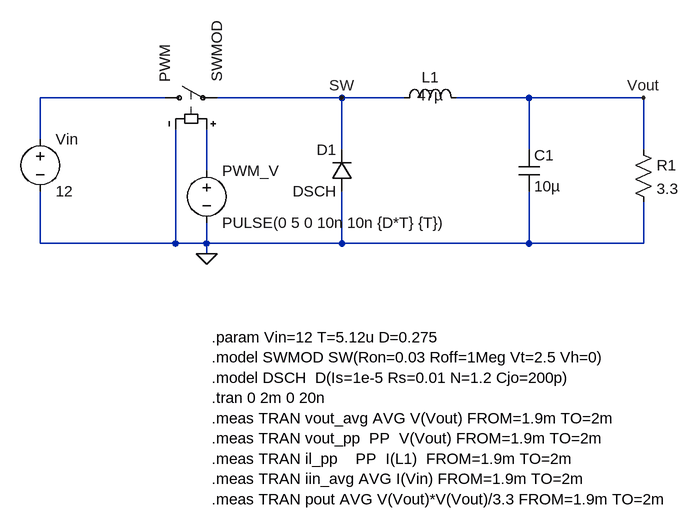
[diagram p0: schematic buck converter - 1.asc]
buck converter - 1.asc, the LTspice schematic file:
Version 4.1
SHEET 1 1080 680
WIRE 256 16 64 16
WIRE 528 16 336 16
WIRE 624 16 528 16
WIRE 816 16 704 16
WIRE 992 16 816 16
WIRE 64 80 64 16
WIRE 528 96 528 16
WIRE 816 96 816 16
WIRE 992 96 992 16
WIRE 320 128 320 64
WIRE 64 240 64 160
WIRE 272 240 272 64
WIRE 272 240 64 240
WIRE 320 240 320 208
WIRE 320 240 272 240
WIRE 528 240 528 160
WIRE 528 240 320 240
WIRE 816 240 816 160
WIRE 816 240 528 240
WIRE 992 240 992 176
WIRE 992 240 816 240
WIRE 320 256 320 240
FLAG 320 256 0
FLAG 528 16 SW
FLAG 992 16 Vout
SYMBOL voltage 64 64 R0
WINDOW 123 0 0 Left 0
WINDOW 39 0 0 Left 0
SYMATTR InstName Vin
SYMATTR Value 12
SYMBOL voltage 320 112 R0
WINDOW 123 0 0 Left 0
WINDOW 39 0 0 Left 0
SYMATTR InstName PWM_V
SYMATTR Value PULSE(0 5 0 10n 10n {D*T} {T})
SYMBOL sw 240 16 R270
SYMATTR InstName PWM
SYMATTR Value SWMOD
SYMBOL diode 544 160 R180
WINDOW 0 24 64 Left 2
WINDOW 3 24 0 Left 2
SYMATTR InstName D1
SYMATTR Value DSCH
SYMBOL ind 608 32 R270
WINDOW 0 32 56 VTop 2
WINDOW 3 4 56 VTop 2
SYMATTR InstName L1
SYMATTR Value 47µ
SYMATTR SpiceLine Rser=50m
SYMBOL cap 800 96 R0
SYMATTR InstName C1
SYMATTR SpiceLine Rser=20m
SYMATTR Value 10µ
SYMBOL res 976 80 R0
SYMATTR InstName R1
SYMATTR Value 3.3
TEXT 328 384 Left 2 !.param Vin=12 T=5.12u D=0.275\n.model SWMOD SW(Ron=0.03 Roff=1Meg Vt=2.5 Vh=0)\n.model DSCH  D(Is=1e-5 Rs=0.01 N=1.2 Cjo=200p)\n.tran 0 2m 0 20n\n.meas TRAN vout_avg AVG V(Vout) FROM=1.9m TO=2m\n.meas TRAN vout_pp  PP  V(Vout) FROM=1.9m TO=2m\n.meas TRAN il_pp    PP  I(L1)  FROM=1.9m TO=2m\n.meas TRAN iin_avg AVG I(Vin) FROM=1.9m TO=2m\n.meas TRAN pout AVG V(Vout)*V(Vout)/3.3 FROM=1.9m TO=2m

The netlist it stands for:
* buck converter - 1.asc
Vin N001 0 12
V§PWM_V N002 0 PULSE(0 5 0 10n 10n {D*T} {T})
S§PWM N001 SW N002 0 SWMOD
D1 0 SW DSCH
L1 SW Vout 47µ Rser=50m
C1 Vout 0 10µ Rser=20m
R1 Vout 0 3.3
.model D D
.lib standard.dio
.param Vin=12 T=5.12u D=0.275
.model SWMOD SW(Ron=0.03 Roff=1Meg Vt=2.5 Vh=0)
.model DSCH  D(Is=1e-5 Rs=0.01 N=1.2 Cjo=200p)
.tran 0 2m 0 20n
.meas TRAN vout_avg AVG V(Vout) FROM=1.9m TO=2m
.meas TRAN vout_pp  PP  V(Vout) FROM=1.9m TO=2m
.meas TRAN il_pp    PP  I(L1)  FROM=1.9m TO=2m
.meas TRAN iin_avg AVG I(Vin) FROM=1.9m TO=2m
.meas TRAN pout AVG V(Vout)*V(Vout)/3.3 FROM=1.9m TO=2m
.backanno
.end